# Altium schematic sheet RF_Tranceiver_433.SchDoc
size A3
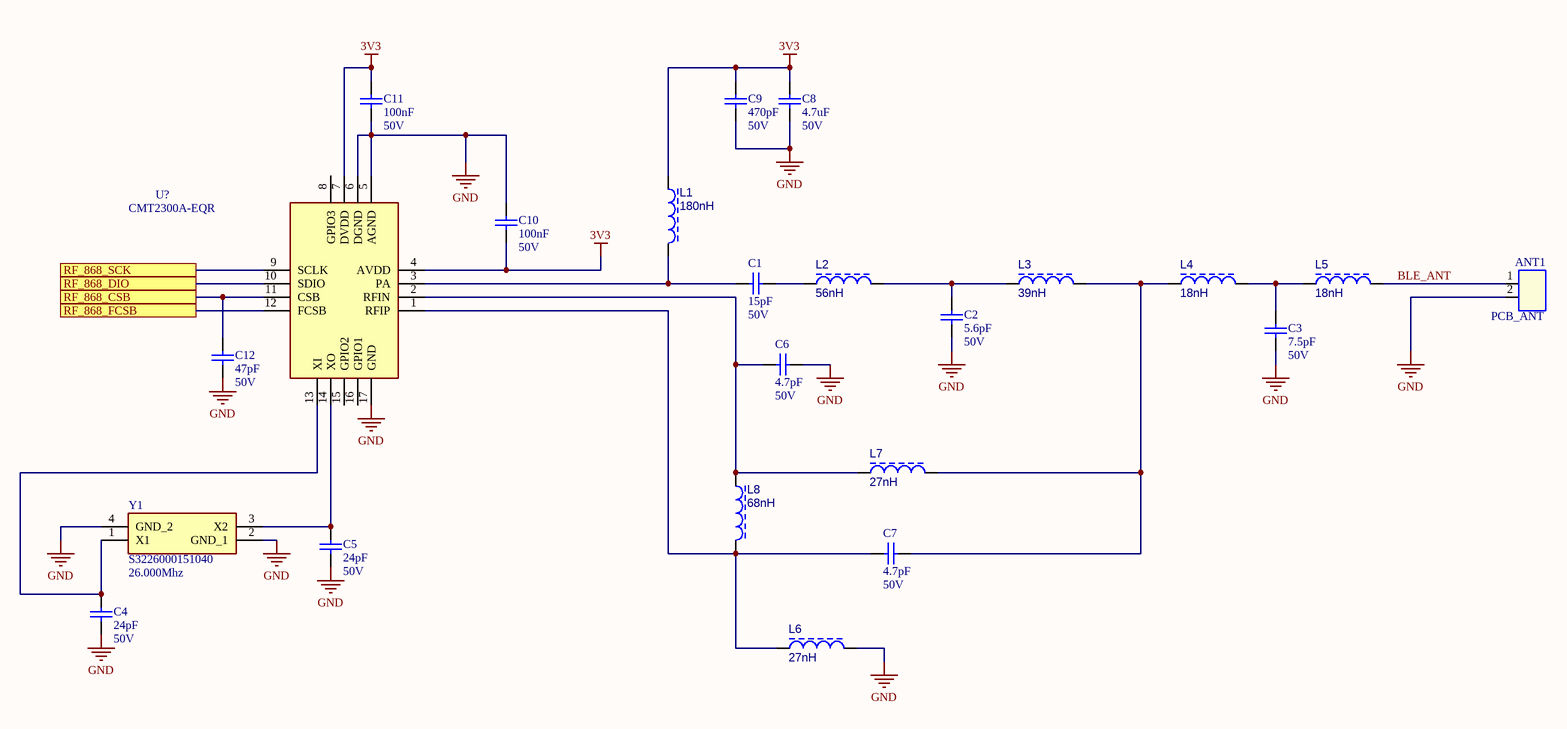
[diagram p0: RF_Tranceiver_433.SchDoc]

## Parts
ANT1  PCB_ANT  [MINI-ANT-TYPEB]  (no BOM)
C1  value 15pF  Voltage: 50V  [CAP_0603]  (hidden comment: CAP)
C2  value 5.6pF  Voltage: 50V  [CAP_0603]  (hidden comment: CAP)
C3  value 7.5pF  Voltage: 50V  [CAP_0603]  (hidden comment: CAP)
C4  value 24pF  Voltage: 50V  [CAP_0603]  (hidden comment: CAP)
C5  value 24pF  Voltage: 50V  [CAP_0603]  (hidden comment: CAP)
C6  value 4.7pF  Voltage: 50V  [CAP_0603]  (hidden comment: CAP)
C7  value 4.7pF  Voltage: 50V  [CAP_0603]  (hidden comment: CAP)
C8  value 4.7uF  Voltage: 50V  [CAP_0603]  (hidden comment: CAP)
C9  value 470pF  Voltage: 50V  [CAP_0603]  (hidden comment: CAP)
C10  value 100nF  Voltage: 50V  [CAP_0603]  (hidden comment: CAP)
C11  value 100nF  Voltage: 50V  [CAP_0603]  (hidden comment: CAP)
C12  value 47pF  Voltage: 50V  [CAP_0603]  (hidden comment: CAP)
L1  value 180nH  [RES_0603]  (hidden comment: BLM18AG102SN1D)
L2  value 56nH  [RES_0603]  (hidden comment: BLM18AG102SN1D)
L3  value 39nH  [RES_0603]  (hidden comment: BLM18AG102SN1D)
L4  value 18nH  [RES_0603]  (hidden comment: BLM18AG102SN1D)
L5  value 18nH  [RES_0603]  (hidden comment: BLM18AG102SN1D)
L6  value 27nH  [RES_0603]  (hidden comment: BLM18AG102SN1D)
L7  value 27nH  [RES_0603]  (hidden comment: BLM18AG102SN1D)
L8  value 68nH  [RES_0603]  (hidden comment: BLM18AG102SN1D)
U?  CMT2300A-EQR  [QFN50P300X300X80-17N-D]
Y1  S3226000151040  value 26.000Mhz  [ABM810000MHZ12D2W]

## Ports
RF_868_CSB, RF_868_DIO, RF_868_FCSB, RF_868_SCK

## Nets
3V3: C8.1 C9.1 C10.2 C11.1 L1.1 U?.4(AVDD) U?.7(DVDD)
GND: ANT1.2 C2.2 C3.2 C4.2 C5.2 C6.2 C8.2 C9.2 C10.1 C11.2 C12.2 L6.2 U?.5(AGND) U?.6(DGND) U?.17(GND) Y1.2(GND_1) Y1.4(GND_2)
BLE_ANT: ANT1.1 L5.2
RF_868_CSB: C12.1 U?.11(CSB) ; port RF_868_CSB
RF_868_DIO: U?.10(SDIO) ; port RF_868_DIO
RF_868_FCSB: U?.12(FCSB) ; port RF_868_FCSB
RF_868_SCK: U?.9(SCLK) ; port RF_868_SCK
NetC1_1: C1.1 L2.1
NetC1_2: C1.2 L1.2 U?.3(PA)
NetC2_1: C2.1 L2.2 L3.1
NetC3_1: C3.1 L4.2 L5.1
NetC4_1: C4.1 U?.13(XI) Y1.1(X1)
NetC5_1: C5.1 U?.14(XO) Y1.3(X2)
NetC6_1: C6.1 L7.1 L8.1 U?.2(RFIN)
NetC7_1: C7.1 L6.1 L8.2 U?.1(RFIP)
NetC7_2: C7.2 L3.2 L4.1 L7.2

Not connected (* = marked no-connect by the designer): U? 8(GPIO3) 15(GPIO2) 16(GPIO1)

## Library data of the parts
C1-C12 = C01763: CAP CER 100nF 50VDC %10 X7R SMD; Manufacturer: Samsung; Manufacturer Part Number: CL10B104KB8NNNL
L1-L8 = BLM18AG102SN1D: FERRITE BEAD 0603 1K 400MA MURATA; Package: 0603 (1608 Metric); Manufacturer: MURATA; Manufacturer Part Number: BLM18AG102SN1D; Supplier Part Number 1: BLM18AG102SN1D; Supplier Part Number 2: 490-1015-2-ND; Supplier Part Number 3: 81-BLM11A102S; Supplier 1: OZDISAN; Supplier 2: DIGIKEY; Supplier 3: MOUSER
U? = CMT2300A: Ultra-low-power Sub-1GHz RF transceiver; Manufacturer_Name: Hope Microelectronics; Datasheet Link: http://www.cmostek.com/download/CMT2300A-CN-Rev0.7.pdf; Height: 0.8mm; Manufacturer_Part_Number: CMT2300A-EQR
Y1 = ABM8-26.000MHZ-10-1-U-T: CRYSTAL 26MHz 15pF SMD; Manufacturer_Name: JGHC; Datasheet Link: https://abracon.com/Resonators/abm8.pdf; Manufacturer_Part_Number: S3226000151040; Mouser Part Number: 815-ABM8-26-T; Mouser Price/Stock: https://www.mouser.co.uk/ProductDetail/ABRACON/ABM8-26.000MHZ-10-1-U-T?qs=76dmnhCH%2FMP1JRP6EvWbSw%3D%3D; Arrow Part Number: ABM8-26.000MHZ-10-1-U-T; Arrow Price/Stock: https://www.arrow.com/en/products/abm8-26.000mhz-10-1-u-t/abracon?utm_currency=USD&region=nac